# Altium schematic sheet 08_Voltage_Translator.SchDoc
size A3; SheetNumber: 11; SheetTotal: 21
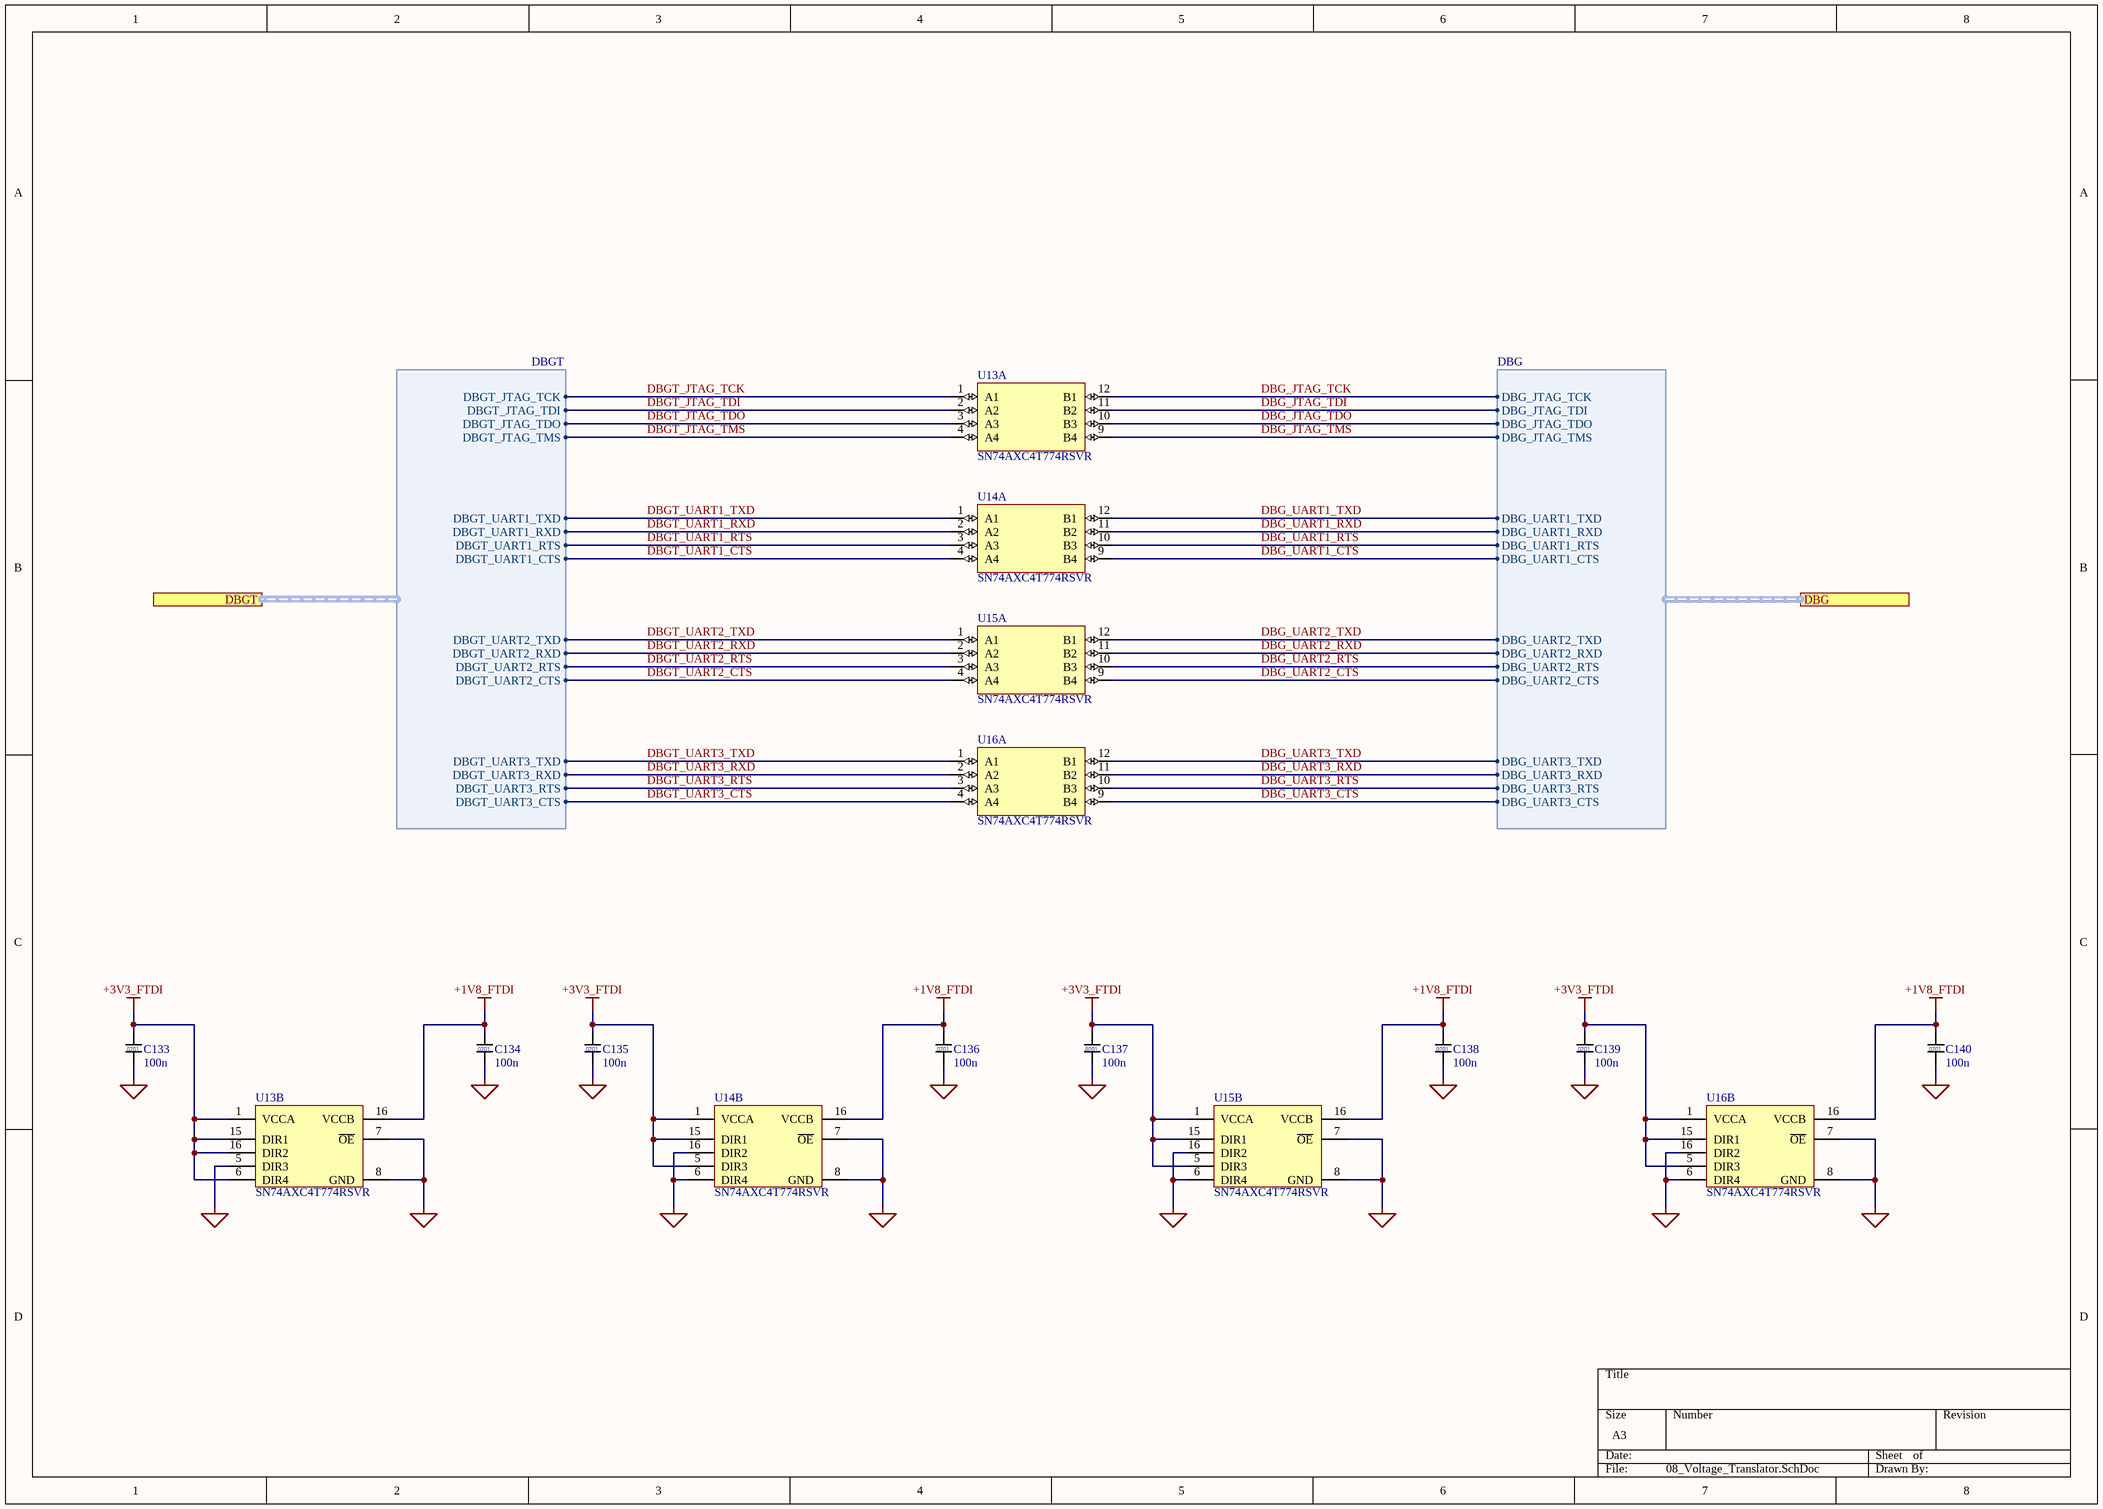
[diagram p0: 08_Voltage_Translator.SchDoc]

## Parts
C133  value 100n  [C0201]  (hidden comment: C_0201)
C134  value 100n  [C0201]  (hidden comment: C_0201)
C135  value 100n  [C0201]  (hidden comment: C_0201)
C136  value 100n  [C0201]  (hidden comment: C_0201)
C137  value 100n  [C0201]  (hidden comment: C_0201)
C138  value 100n  [C0201]  (hidden comment: C_0201)
C139  value 100n  [C0201]  (hidden comment: C_0201)
C140  value 100n  [C0201]  (hidden comment: C_0201)
U13  SN74AXC4T774RSVR  [UQFN-16_1.8x2.6mm_P0.4mm]  (parts A,B of 2)
U14  SN74AXC4T774RSVR  [UQFN-16_1.8x2.6mm_P0.4mm]  (parts A,B of 2)
U15  SN74AXC4T774RSVR  [UQFN-16_1.8x2.6mm_P0.4mm]  (parts A,B of 2)
U16  SN74AXC4T774RSVR  [UQFN-16_1.8x2.6mm_P0.4mm]  (parts A,B of 2)

## Ports
DBG (harness DBG, see SBC_SCH[3D]), DBGT (harness DBGT, see SBC_SCH[3D], FTDI_USB[8B])

## Harnesses
DBGT: DBGT_JTAG_TCK, DBGT_JTAG_TDI, DBGT_JTAG_TDO, DBGT_JTAG_TMS, DBGT_UART1_TXD, DBGT_UART1_RXD, DBGT_UART1_RTS, DBGT_UART1_CTS, DBGT_UART2_TXD, DBGT_UART2_RXD, DBGT_UART2_RTS, DBGT_UART2_CTS, DBGT_UART3_TXD, DBGT_UART3_RXD, DBGT_UART3_RTS, DBGT_UART3_CTS
DBG: DBG_JTAG_TCK, DBG_JTAG_TDI, DBG_JTAG_TDO, DBG_JTAG_TMS, DBG_UART1_TXD, DBG_UART1_RXD, DBG_UART1_RTS, DBG_UART1_CTS, DBG_UART2_TXD, DBG_UART2_RXD, DBG_UART2_RTS, DBG_UART2_CTS, DBG_UART3_TXD, DBG_UART3_RXD, DBG_UART3_RTS, DBG_UART3_CTS

## Nets
+1V8_FTDI: C134.1 C136.1 C138.1 C140.1 U13.16(VCCB) U14.16(VCCB) U15.16(VCCB) U16.16(VCCB)
+3V3_FTDI: C133.1 C135.1 C137.1 C139.1 U13.1(VCCA) U13.6(DIR4) U13.15(DIR1) U13.16(DIR2) U14.1(VCCA) U14.5(DIR3) U14.15(DIR1) U15.1(VCCA) U15.5(DIR3) U15.15(DIR1) U16.1(VCCA) U16.5(DIR3) U16.15(DIR1)
GND: C133.2 C134.2 C135.2 C136.2 C137.2 C138.2 C139.2 C140.2 U13.5(DIR3) U13.7(~{OE}) U13.8(GND) U14.6(DIR4) U14.7(~{OE}) U14.8(GND) U14.16(DIR2) U15.6(DIR4) U15.7(~{OE}) U15.8(GND) U15.16(DIR2) U16.6(DIR4) U16.7(~{OE}) U16.8(GND) U16.16(DIR2)
DBG_JTAG_TCK: U13.12(B1) ; port DBG.DBG_JTAG_TCK
DBG_JTAG_TDI: U13.11(B2) ; port DBG.DBG_JTAG_TDI
DBG_JTAG_TDO: U13.10(B3) ; port DBG.DBG_JTAG_TDO
DBG_JTAG_TMS: U13.9(B4) ; port DBG.DBG_JTAG_TMS
DBG_UART1_CTS: U14.9(B4) ; port DBG.DBG_UART1_CTS
DBG_UART1_RTS: U14.10(B3) ; port DBG.DBG_UART1_RTS
DBG_UART1_RXD: U14.11(B2) ; port DBG.DBG_UART1_RXD
DBG_UART1_TXD: U14.12(B1) ; port DBG.DBG_UART1_TXD
DBG_UART2_CTS: U15.9(B4) ; port DBG.DBG_UART2_CTS
DBG_UART2_RTS: U15.10(B3) ; port DBG.DBG_UART2_RTS
DBG_UART2_RXD: U15.11(B2) ; port DBG.DBG_UART2_RXD
DBG_UART2_TXD: U15.12(B1) ; port DBG.DBG_UART2_TXD
DBG_UART3_CTS: U16.9(B4) ; port DBG.DBG_UART3_CTS
DBG_UART3_RTS: U16.10(B3) ; port DBG.DBG_UART3_RTS
DBG_UART3_RXD: U16.11(B2) ; port DBG.DBG_UART3_RXD
DBG_UART3_TXD: U16.12(B1) ; port DBG.DBG_UART3_TXD
DBGT_JTAG_TCK: U13.1(A1) ; port DBGT.DBGT_JTAG_TCK
DBGT_JTAG_TDI: U13.2(A2) ; port DBGT.DBGT_JTAG_TDI
DBGT_JTAG_TDO: U13.3(A3) ; port DBGT.DBGT_JTAG_TDO
DBGT_JTAG_TMS: U13.4(A4) ; port DBGT.DBGT_JTAG_TMS
DBGT_UART1_CTS: U14.4(A4) ; port DBGT.DBGT_UART1_CTS
DBGT_UART1_RTS: U14.3(A3) ; port DBGT.DBGT_UART1_RTS
DBGT_UART1_RXD: U14.2(A2) ; port DBGT.DBGT_UART1_RXD
DBGT_UART1_TXD: U14.1(A1) ; port DBGT.DBGT_UART1_TXD
DBGT_UART2_CTS: U15.4(A4) ; port DBGT.DBGT_UART2_CTS
DBGT_UART2_RTS: U15.3(A3) ; port DBGT.DBGT_UART2_RTS
DBGT_UART2_RXD: U15.2(A2) ; port DBGT.DBGT_UART2_RXD
DBGT_UART2_TXD: U15.1(A1) ; port DBGT.DBGT_UART2_TXD
DBGT_UART3_CTS: U16.4(A4) ; port DBGT.DBGT_UART3_CTS
DBGT_UART3_RTS: U16.3(A3) ; port DBGT.DBGT_UART3_RTS
DBGT_UART3_RXD: U16.2(A2) ; port DBGT.DBGT_UART3_RXD
DBGT_UART3_TXD: U16.1(A1) ; port DBGT.DBGT_UART3_TXD

## Notes on the sheet
- (in symbol C_0201) 0201

## Library data of the parts
C133-C140 = C_0201: MLCC 0201; Manufacturer_Name: *; Manufacturer_Part_Number: *
U13-U16 = SN74AXC4T774RSVR: 4-Bit Dual-Supply Bus Transceiver With Configurable Voltage Translation and 3-State Outputs, 16-UQFN (2.6x1.8); Manufacturer_Name: Texas Instruments; Datasheet: https://www.ti.com/lit/ds/symlink/sn74axc4t774.pdf?HQS=dis-dk-null-digikeymode-dsf-pf-null-wwe&ts=1791191909639&ref_url=https%253A%252F%252Fwww.ti.com%252Fgeneral%252Fdocs%252Fsuppproductinfo.tsp%253FdistId%253D10%2526gotoUrl%253Dhttps%253A%252F%252Fwww.ti.com%252Flit%252Fgpn%252Fsn74axc4t774; Manufacturer_Part_Number: SN74AXC4T774RSVR; Value: SN74AXC4T774RSVR